# Altium schematic sheet 300yuan.SchDoc
size A4; SheetNumber: 1; SheetTotal: 1
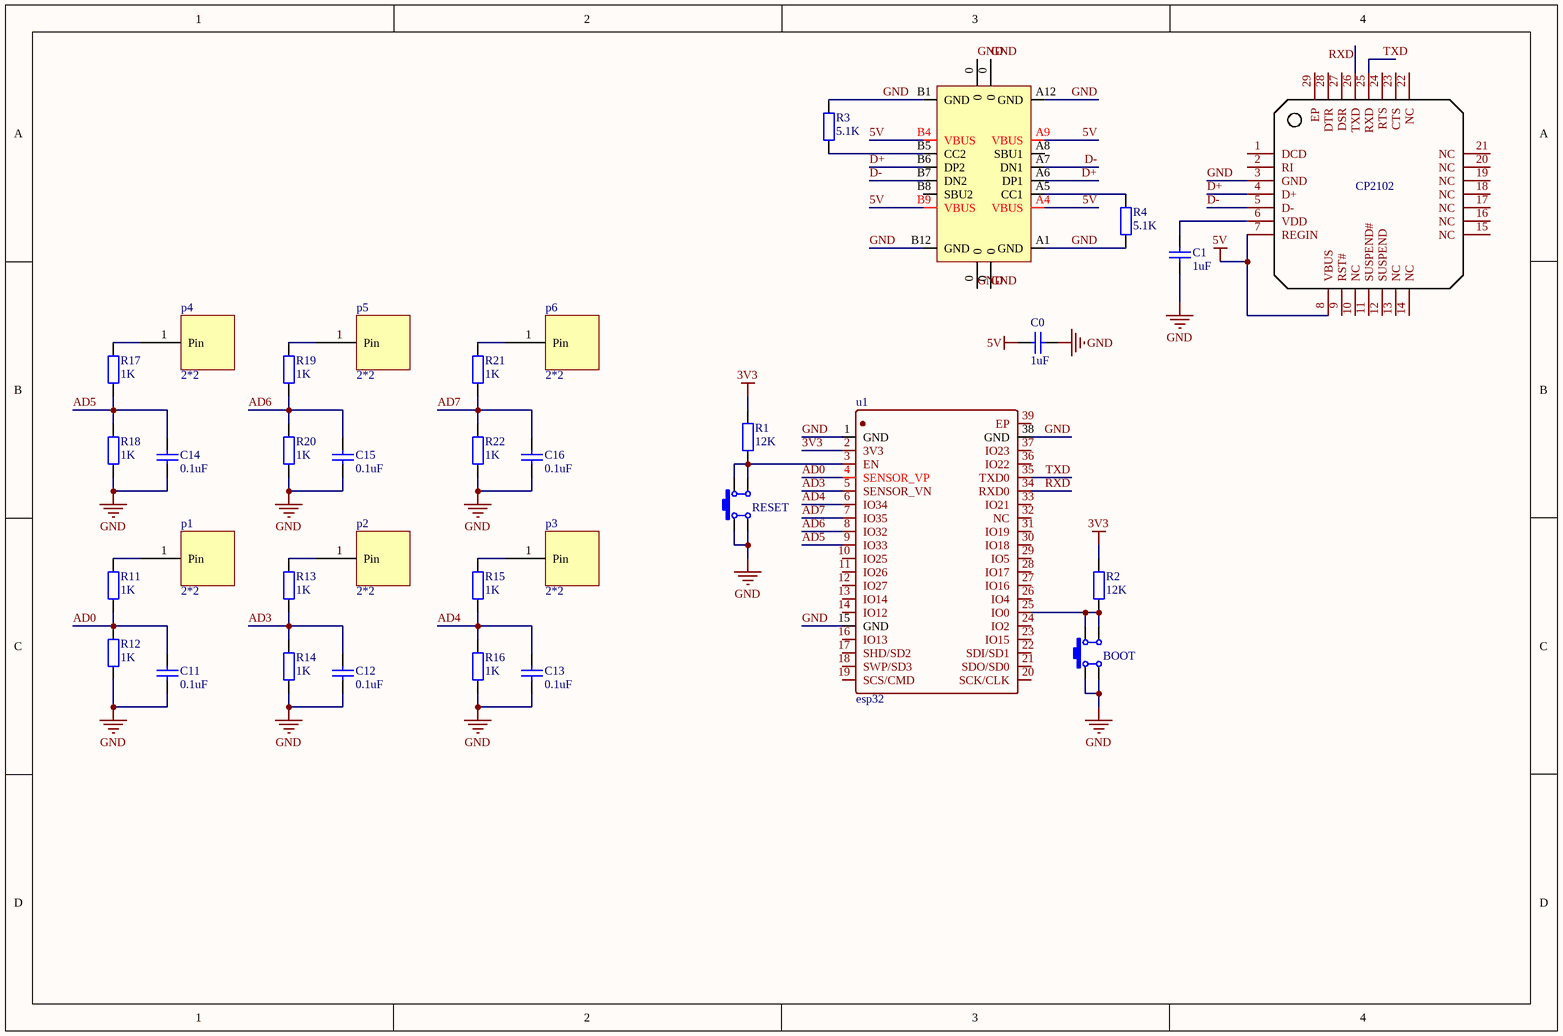
[diagram p0: 300yuan.SchDoc]

## Parts
BOOT  4x4x1.5  [SW SMD-4*4*1.5]  (value not drawn)
C0  1uF  [C0603_L]
C1  1uF  [C0603_L]
C11  0.1uF  [C0603_L]
C12  0.1uF  [C0603_L]
C13  0.1uF  [C0603_L]
C14  0.1uF  [C0603_L]
C15  0.1uF  [C0603_L]
C16  0.1uF  [C0603_L]
CP2102  (no value)  [PCBComponent_1]
p1  2*2  [2*2]
p2  2*2  [2*2]
p3  2*2  [2*2]
p4  2*2  [2*2]
p5  2*2  [2*2]
p6  2*2  [2*2]
R1  12K  [R0603_L]
R2  12K  [R0603_L]
R3  5.1K  [R0603_L]
R4  5.1K  [R0603_L]
R11  1K  [R0603_L]
R12  1K  [R0603_L]
R13  1K  [R0603_L]
R14  1K  [R0603_L]
R15  1K  [R0603_L]
R16  1K  [R0603_L]
R17  1K  [R0603_L]
R18  1K  [R0603_L]
R19  1K  [R0603_L]
R20  1K  [R0603_L]
R21  1K  [R0603_L]
R22  1K  [R0603_L]
RESET  4x4x1.5  [SW SMD-4*4*1.5]  (value not drawn)
u1  esp32  [esp32]
UART  TYPE-C 2.0 -16P  [USB-C-SMD_16P]  (value not drawn)

## Nets
3V3: R1.2 R2.2 u1.2(3V3)
5V: C0.2 CP2102.7(REGIN) CP2102.8(VBUS) UART.A4(VBUS) UART.A9(VBUS) UART.B4(VBUS) UART.B9(VBUS)
GND: BOOT.1 BOOT.4 C0.1 C1.1 C11.1 C12.1 C13.1 C14.1 C15.1 C16.1 CP2102.3(GND) R3.1 R4.2 R12.1 R14.1 R16.1 R18.1 R20.1 R22.1 RESET.1 RESET.4 u1.1(GND) u1.15(GND) u1.38(GND) UART.0 UART.A1(GND) UART.A12(GND) UART.B1(GND) UART.B12(GND)
AD0: C11.2 R11.1 R12.2 u1.4(SENSOR_VP)
AD3: C12.2 R13.1 R14.2 u1.5(SENSOR_VN)
AD4: C13.2 R15.1 R16.2 u1.6(IO34)
AD5: C14.2 R17.1 R18.2 u1.9(IO33)
AD6: C15.2 R19.1 R20.2 u1.8(IO32)
AD7: C16.2 R21.1 R22.2 u1.7(IO35)
D+: CP2102.4(D+) UART.A6(DP1) UART.B6(DP2)
D-: CP2102.5(D-) UART.A7(DN1) UART.B7(DN2)
RXD: CP2102.26(TXD) u1.34(RXD0)
TXD: CP2102.25(RXD) u1.35(TXD0)
NetBOOT_2: BOOT.2 BOOT.3 R2.1 u1.25(IO0)
NetC1_2: C1.2 CP2102.6(VDD)
Netp1_1: p1.1(Pin) R11.2
Netp2_1: p2.1(Pin) R13.2
Netp3_1: p3.1(Pin) R15.2
Netp4_1: p4.1(Pin) R17.2
Netp5_1: p5.1(Pin) R19.2
Netp6_1: p6.1(Pin) R21.2
NetR1_1: R1.1 RESET.2 RESET.3 u1.3(EN)
NetR3_2: R3.2 UART.B5(CC2)
NetR4_1: R4.1 UART.A5(CC1)

Not connected (* = marked no-connect by the designer): CP2102 1(DCD) 2(RI) 9(RST#) 10(NC) 11(SUSPEND#) 12(SUSPEND) 13(NC) 14(NC) 15(NC) 16(NC) 17(NC) 18(NC) 19(NC) 20(NC) 21(NC) 22(NC) 23(CTS) 24(RTS) 27(DSR) 28(DTR) 29(EP); u1 10(IO25) 11(IO26) 12(IO27) 13(IO14) 14(IO12) 16(IO13) 17(SHD/SD2) 18(SWP/SD3) 19(SCS/CMD) 20(SCK/CLK) 21(SDO/SD0) 22(SDI/SD1) 23(IO15) 24(IO2) 26(IO4) 27(IO16) 28(IO17) 29(IO5) 30(IO18) 31(IO19) 32(NC) 33(IO21) 36(IO22) 37(IO23) 39(EP); UART A8(SBU1) B8(SBU2)

## Library data of the parts
BOOT RESET = SW SMD-4x4: 贴片4x4轻触开关; 联系卖家，免费查找封装: 唯一出售店铺网址https://shop463601444.taobao.com; 封装库来自淘宝卖家ID：黄晶宝石: 其他店铺购入均为盗版假冒封装库，请立即申请退款; BOM名称: 贴片4x4轻触开关
C0 C1 C11-C16 = C: 贴片电容; BOM名称: 无极性贴片电容; 联系卖家，免费查找封装: 唯一出售店铺网址https://shop463601444.taobao.com; 封装库来自淘宝卖家ID： 黄晶宝石: 其他店铺购入均为盗版假冒封装库，请立即申请退款，本店现金奖励5-50元
CP2102 = cp2102
R1-R4 R11-R22 = R: 贴片电阻; 联系卖家，免费查找封装: 唯一出售店铺网址https://shop463601444.taobao.com; 封装库来自淘宝卖家ID： 黄晶宝石: 其他店铺购入均为盗版假冒封装库，请立即申请退款，本店现金奖励5-50元; BOM名称: 贴片电阻
UART = USB2.0_Type-C_16Pin: USB2.0_Type-C_16Pin母座; 联系卖家 免费查找封装: 唯一出售店铺网址https://shop463601444.taobao.com; 联系卖家 免费技术支持: 封装库来自淘宝卖家ID：黄晶宝石